# Altium schematic sheet 70_DEBUG_BOOT.SchDoc
size 209 x 148 mm
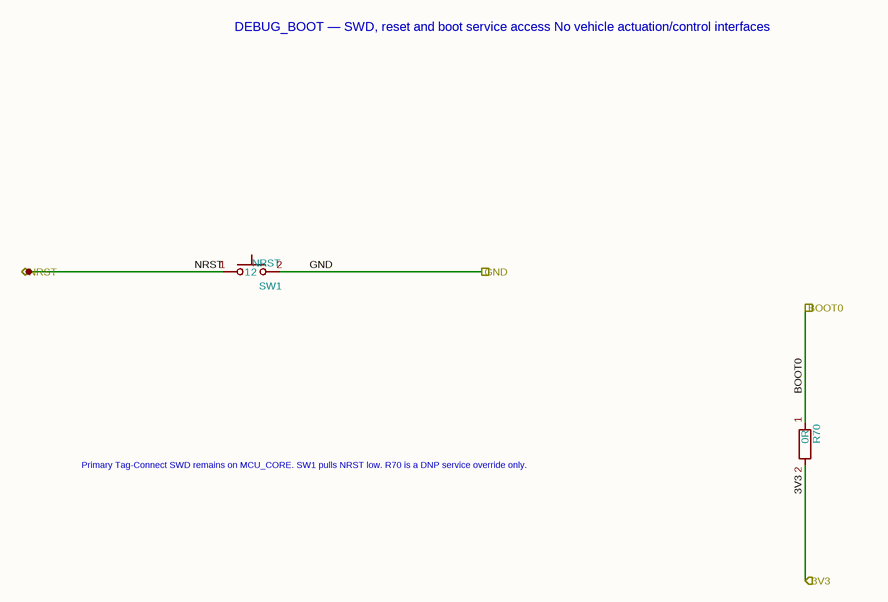
[diagram p0: 70_DEBUG_BOOT.SchDoc]

## Parts
R70  0R  [R_0603_1608Metric]
SW1  NRST  [ESwitch_TL3301_GullWing_6x6]

## Ports
3V3 (in), BOOT0, GND, NRST (bidir)

## Nets
3V3: R70.2 ; port 3V3
BOOT0: R70.1 ; port BOOT0
GND: SW1.2 ; port GND
NRST: SW1.1 ; port NRST

## Notes on the sheet
- DEBUG_BOOT — SWD, reset and boot service access
  No vehicle actuation/control interfaces
- Primary Tag-Connect SWD remains on MCU_CORE.
  SW1 pulls NRST low. R70 is a DNP
  service override only.
- 1
- 2
- 3
- 4
- A
- B
- Title: EVT_SYS_CARRIER
- File: 70_DEBUG_BOOT.kicad_sch
- Sheet: /
- C
- KiCad E.D.A.  kicad (5.1.4)-1
- Size: A5
- Date:
- Rev:
- Id: 1/1

## Library data of the parts
R70 = R: hierarchy_path: /66980d89-56fb-4772-93a7-06a61d388399/3686b07d-3d02-4fcb-be66-106e5ebdc9c7; MPN: 0R; Value: 0R; Footprint: Resistor_SMD:R_0603_1608Metric
SW1 = SW_Push: MPN: TL3301NF160QG; hierarchy_path: /66980d89-56fb-4772-93a7-06a61d388399/3686b07d-3d02-4fcb-be66-106e5ebdc9c7; Value: NRST; Footprint: SystemCarrier_Altium:ESwitch_TL3301_GullWing_6x6